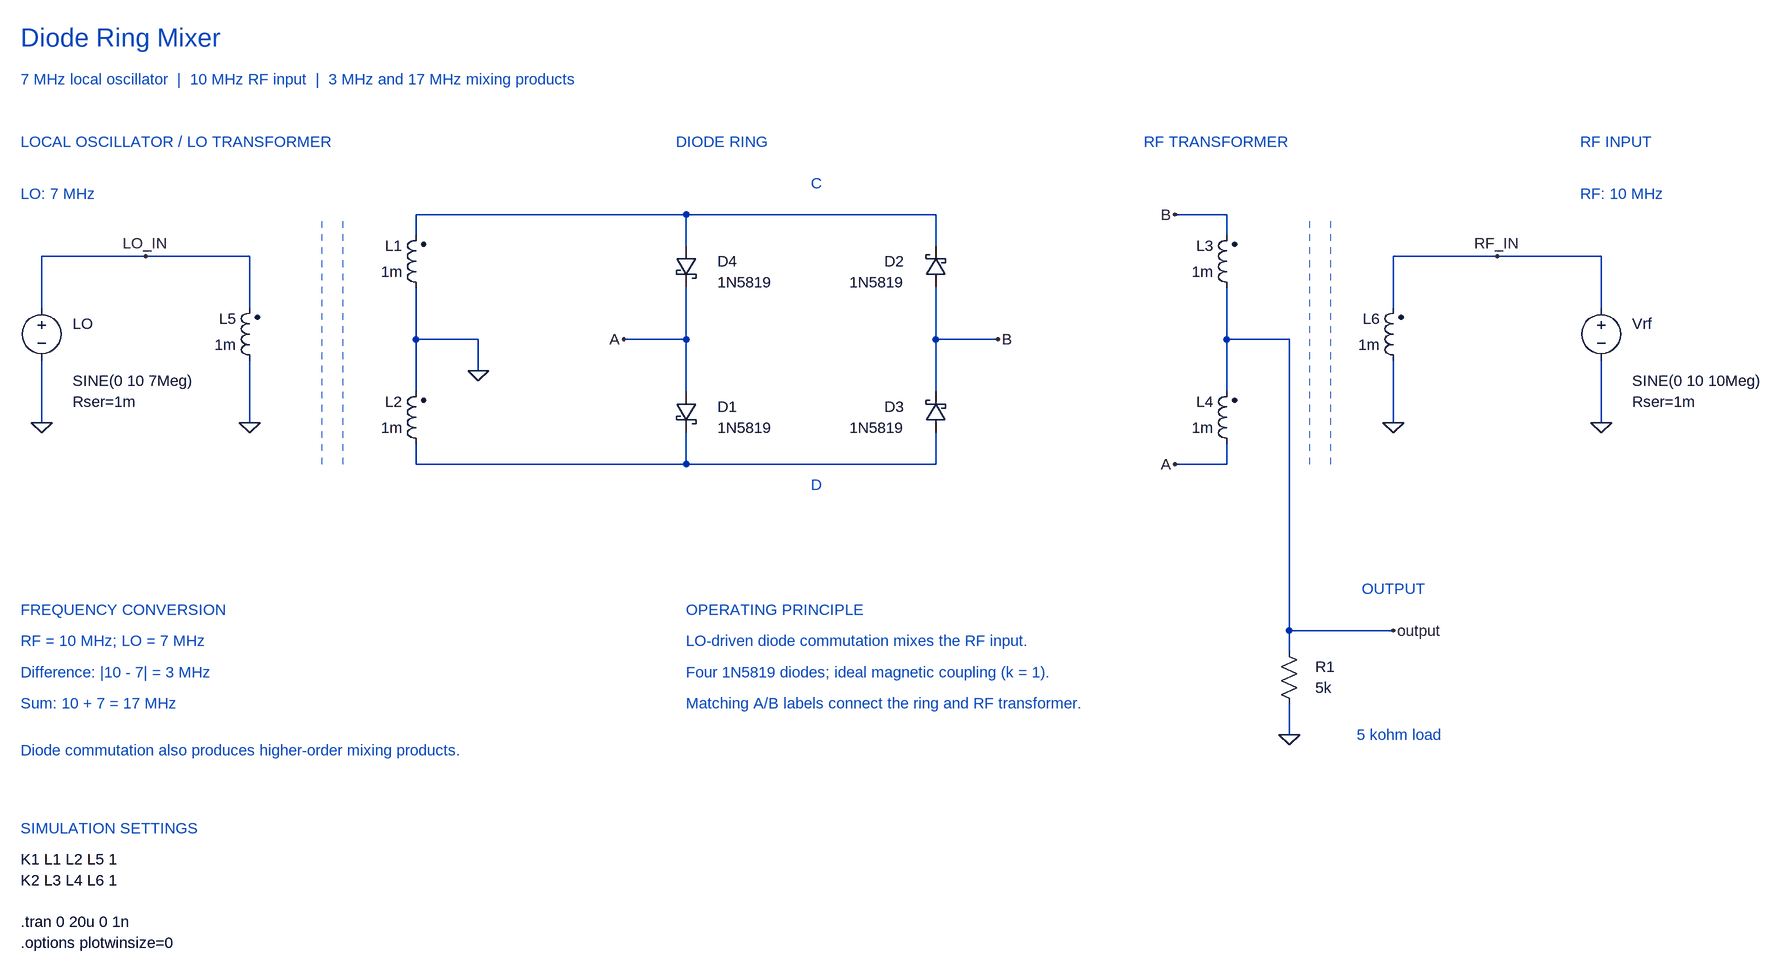
[diagram p0: schematic Diode_Ring_Mixer_Simulation.asc]
Diode_Ring_Mixer_Simulation.asc, the LTspice schematic file:
Version 4
SHEET 1 3072 1536
WIRE 160 464 160 384
WIRE 160 384 320 384
WIRE 320 384 480 384
WIRE 480 384 480 464
WIRE 160 544 160 640
WIRE 480 544 480 640
WIRE 736 352 736 320
WIRE 736 320 1152 320
WIRE 736 432 736 512
WIRE 736 512 736 592
WIRE 736 512 832 512
WIRE 832 512 832 560
WIRE 736 672 736 704
WIRE 736 704 1152 704
WIRE 1152 320 1344 320
WIRE 1344 320 1536 320
WIRE 1152 320 1152 368
WIRE 1536 320 1536 368
WIRE 1152 432 1152 512
WIRE 1152 512 1152 592
WIRE 1536 432 1536 512
WIRE 1536 512 1536 592
WIRE 1152 656 1152 704
WIRE 1536 656 1536 704
WIRE 1152 704 1344 704
WIRE 1344 704 1536 704
WIRE 1056 512 1152 512
WIRE 1536 512 1632 512
WIRE 1904 320 1984 320
WIRE 1984 320 1984 352
WIRE 1904 704 1984 704
WIRE 1984 704 1984 672
WIRE 1984 432 1984 512
WIRE 1984 512 1984 592
WIRE 1984 512 2080 512
WIRE 2080 512 2080 960
WIRE 2080 960 2240 960
WIRE 2080 960 2080 992
WIRE 2080 1072 2080 1120
WIRE 2240 464 2240 384
WIRE 2240 384 2400 384
WIRE 2400 384 2560 384
WIRE 2560 384 2560 464
WIRE 2240 544 2240 640
WIRE 2560 544 2560 640
FLAG 320 384 LO_IN
FLAG 160 640 0
FLAG 480 640 0
FLAG 832 560 0
FLAG 1056 512 A
FLAG 1632 512 B
FLAG 1904 320 B
FLAG 1904 704 A
FLAG 2240 960 output
FLAG 2080 1120 0
FLAG 2400 384 RF_IN
FLAG 2240 640 0
FLAG 2560 640 0
SYMBOL ind2 752 448 R180
WINDOW 0 36 80 Left 2
WINDOW 3 36 40 Left 2
SYMATTR InstName L1
SYMATTR Value 1m
SYMATTR Type ind
SYMBOL ind2 752 688 R180
WINDOW 0 36 80 Left 2
WINDOW 3 36 40 Left 2
SYMATTR InstName L2
SYMATTR Value 1m
SYMATTR Type ind
SYMBOL ind2 2000 448 R180
WINDOW 0 36 80 Left 2
WINDOW 3 36 40 Left 2
SYMATTR InstName L3
SYMATTR Value 1m
SYMATTR Type ind
SYMBOL ind2 2000 688 R180
WINDOW 0 36 80 Left 2
WINDOW 3 36 40 Left 2
SYMATTR InstName L4
SYMATTR Value 1m
SYMATTR Type ind
SYMBOL ind2 496 560 R180
WINDOW 0 36 80 Left 2
WINDOW 3 36 40 Left 2
SYMATTR InstName L5
SYMATTR Value 1m
SYMATTR Type ind
SYMBOL ind2 2256 560 R180
WINDOW 0 36 80 Left 2
WINDOW 3 36 40 Left 2
SYMATTR InstName L6
SYMATTR Value 1m
SYMATTR Type ind
SYMBOL voltage 160 448 R0
WINDOW 0 48 40 Left 2
WINDOW 3 48 128 Left 2
WINDOW 39 48 160 Left 2
WINDOW 123 0 0 Left 0
SYMATTR SpiceLine Rser=1m
SYMATTR InstName LO
SYMATTR Value SINE(0 10 7Meg)
SYMBOL voltage 2560 448 R0
WINDOW 0 48 40 Left 2
WINDOW 3 48 128 Left 2
WINDOW 39 48 160 Left 2
WINDOW 123 0 0 Left 0
SYMATTR SpiceLine Rser=1m
SYMATTR InstName Vrf
SYMATTR Value SINE(0 10 10Meg)
SYMBOL res 2064 976 R0
WINDOW 0 56 40 Left 2
WINDOW 3 56 72 Left 2
SYMATTR InstName R1
SYMATTR Value 5k
SYMBOL schottky 1552 432 R180
WINDOW 0 64 40 Left 2
WINDOW 3 64 8 Left 2
SYMATTR InstName D2
SYMATTR Value 1N5819
SYMATTR Description Diode
SYMATTR Type diode
SYMBOL schottky 1552 656 R180
WINDOW 0 64 40 Left 2
WINDOW 3 64 8 Left 2
SYMATTR InstName D3
SYMATTR Value 1N5819
SYMATTR Description Diode
SYMATTR Type diode
SYMBOL schottky 1136 592 R0
WINDOW 0 64 24 Left 2
WINDOW 3 64 56 Left 2
SYMATTR InstName D1
SYMATTR Value 1N5819
SYMATTR Description Diode
SYMATTR Type diode
SYMBOL schottky 1136 368 R0
WINDOW 0 64 24 Left 2
WINDOW 3 64 56 Left 2
SYMATTR InstName D4
SYMATTR Value 1N5819
SYMATTR Description Diode
SYMATTR Type diode
TEXT 128 48 Left 4 ;Diode Ring Mixer
TEXT 128 112 Left 2 ;7 MHz local oscillator  |  10 MHz RF input  |  3 MHz and 17 MHz mixing products
TEXT 128 208 Left 2 ;LOCAL OSCILLATOR / LO TRANSFORMER
TEXT 1136 208 Left 2 ;DIODE RING
TEXT 1856 208 Left 2 ;RF TRANSFORMER
TEXT 2528 208 Left 2 ;RF INPUT
TEXT 128 288 Left 2 ;LO: 7 MHz
TEXT 2528 288 Left 2 ;RF: 10 MHz
TEXT 1344 272 Left 2 ;C
TEXT 1344 736 Left 2 ;D
TEXT 2192 896 Left 2 ;OUTPUT
TEXT 2184 1120 Left 2 ;5 kohm load
TEXT 128 928 Left 2 ;FREQUENCY CONVERSION
TEXT 128 976 Left 2 ;RF = 10 MHz; LO = 7 MHz
TEXT 128 1024 Left 2 ;Difference: |10 - 7| = 3 MHz
TEXT 128 1072 Left 2 ;Sum: 10 + 7 = 17 MHz
TEXT 128 1144 Left 2 ;Diode commutation also produces higher-order mixing products.
TEXT 1152 928 Left 2 ;OPERATING PRINCIPLE
TEXT 1152 976 Left 2 ;LO-driven diode commutation mixes the RF input.
TEXT 1152 1024 Left 2 ;Four 1N5819 diodes; ideal magnetic coupling (k = 1).
TEXT 1152 1072 Left 2 ;Matching A/B labels connect the ring and RF transformer.
TEXT 128 1264 Left 2 ;SIMULATION SETTINGS
TEXT 128 1312 Left 2 !K1 L1 L2 L5 1
TEXT 128 1344 Left 2 !K2 L3 L4 L6 1
TEXT 128 1408 Left 2 !.tran 0 20u 0 1n
TEXT 128 1440 Left 2 !.options plotwinsize=0
LINE Normal 592 704 592 320 2
LINE Normal 624 704 624 320 2
LINE Normal 2112 704 2112 320 2
LINE Normal 2144 704 2144 320 2

The netlist it stands for:
* Diode_Ring_Mixer_Simulation.asc
L1 0 N001 1m
L2 N002 0 1m
L3 output B 1m
L4 A output 1m
L5 0 LO_IN 1m
L6 0 RF_IN 1m
V§LO LO_IN 0 SINE(0 10 7Meg) Rser=1m
Vrf RF_IN 0 SINE(0 10 10Meg) Rser=1m
R1 output 0 5k
D2 B N001 1N5819
D3 N002 B 1N5819
D1 A N002 1N5819
D4 N001 A 1N5819
.model D D
.lib standard.dio
* Diode Ring Mixer
* 7 MHz local oscillator  |  10 MHz RF input  |  3 MHz and 17 MHz mixing products
* LOCAL OSCILLATOR / LO TRANSFORMER
* DIODE RING
* RF TRANSFORMER
* RF INPUT
* LO: 7 MHz
* RF: 10 MHz
* C
* D
* OUTPUT
* 5 kohm load
* FREQUENCY CONVERSION
* RF = 10 MHz; LO = 7 MHz
* Difference: |10 - 7| = 3 MHz
* Sum: 10 + 7 = 17 MHz
* Diode commutation also produces higher-order mixing products.
* OPERATING PRINCIPLE
* LO-driven diode commutation mixes the RF input.
* Four 1N5819 diodes; ideal magnetic coupling (k = 1).
* Matching A/B labels connect the ring and RF transformer.
* SIMULATION SETTINGS
K1 L1 L2 L5 1
K2 L3 L4 L6 1
.tran 0 20u 0 1n
.options plotwinsize=0
.backanno
.end